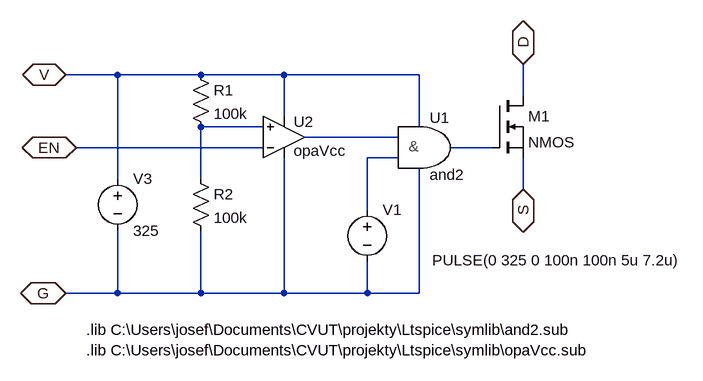
[diagram p0: schematic TNY263.asc]
TNY263.asc, the LTspice schematic file:
Version 4.1
SHEET 1 1584 680
WIRE 688 -544 608 -544
WIRE 816 -544 688 -544
WIRE 944 -544 816 -544
WIRE 1152 -544 944 -544
WIRE 1312 -512 1312 -560
WIRE 944 -480 944 -544
WIRE 912 -464 816 -464
WIRE 1152 -464 1152 -544
WIRE 1120 -448 976 -448
WIRE 912 -432 624 -432
WIRE 1264 -432 1200 -432
WIRE 1120 -416 1072 -416
WIRE 688 -384 688 -544
WIRE 816 -384 816 -464
WIRE 1312 -368 1312 -416
WIRE 1072 -336 1072 -416
WIRE 688 -208 688 -304
WIRE 688 -208 608 -208
WIRE 816 -208 816 -304
WIRE 816 -208 688 -208
WIRE 944 -208 944 -416
WIRE 944 -208 816 -208
WIRE 1072 -208 1072 -256
WIRE 1072 -208 944 -208
WIRE 1152 -208 1152 -400
WIRE 1152 -208 1072 -208
FLAG 624 -432 EN
IOPIN 624 -432 BiDir
FLAG 608 -208 G
IOPIN 608 -208 BiDir
FLAG 1312 -560 D
IOPIN 1312 -560 BiDir
FLAG 1312 -368 S
IOPIN 1312 -368 BiDir
FLAG 608 -544 V
IOPIN 608 -544 BiDir
SYMBOL and2 1152 -432 R0
SYMATTR InstName U1
SYMBOL opaVcc 944 -448 R0
SYMATTR InstName U2
SYMBOL voltage 1072 -352 R0
WINDOW 3 100 93 Left 2
WINDOW 123 0 0 Left 0
WINDOW 39 0 0 Left 0
SYMATTR Value PULSE(0 325 0 100n 100n 5u 7.2u)
SYMATTR InstName V1
SYMBOL nmos 1264 -512 R0
SYMATTR InstName M1
SYMBOL voltage 688 -400 R0
WINDOW 123 0 0 Left 0
WINDOW 39 0 0 Left 0
SYMATTR InstName V3
SYMATTR Value 325
SYMBOL res 800 -560 R0
SYMATTR InstName R1
SYMATTR Value 100k
SYMBOL res 800 -400 R0
SYMATTR InstName R2
SYMATTR Value 100k
TEXT 640 -120 Left 2 !.lib C:\\Users\\josef\\Documents\\CVUT\\projekty\\Ltspice\\symlib\\opaVcc.sub
TEXT 640 -152 Left 2 !.lib C:\\Users\\josef\\Documents\\CVUT\\projekty\\Ltspice\\symlib\\and2.sub

The netlist it stands for:
* TNY263.asc
X§U1 N002 N004 N003 V G and2  ; pins A B Y Vcc Vee
X§U2 EN N001 N002 V G opaVcc  ; pins Vin Vip Vo Vcc Vee
V1 N004 G PULSE(0 325 0 100n 100n 5u 7.2u)
M1 D N003 S S NMOS
V3 V G 325
R1 V N001 100k
R2 N001 G 100k
.model NMOS NMOS
.model PMOS PMOS
.lib standard.mos
.lib C:\Users\josef\Documents\CVUT\projekty\Ltspice\symlib\opaVcc.sub
.lib C:\Users\josef\Documents\CVUT\projekty\Ltspice\symlib\and2.sub
.backanno
.end